# Altium project ARC_1.0.5.PrjPcb (part 1 of 3)
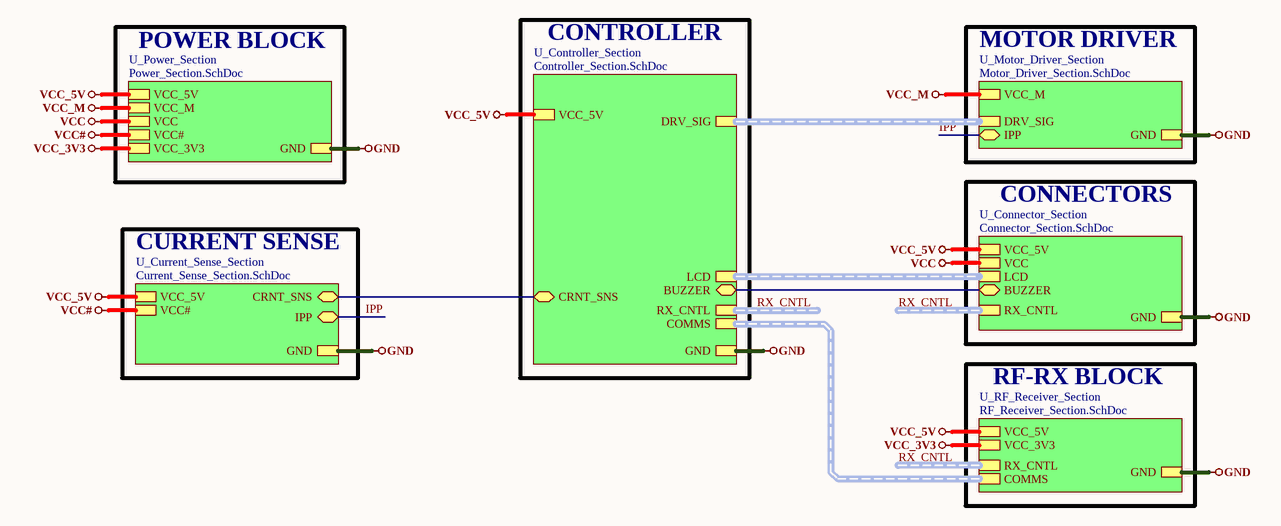
[diagram p0: Top_Sheet.SchDoc]
7 sheets, 201 parts. Net scope: hierarchical (ports join the sheet entries above them; power ports are global).
Board file: PCB_ARC_1.0.5.PcbDoc
Sheets:
  Top_Sheet.SchDoc
    U_Motor_Driver_Section = Motor_Driver_Section.SchDoc
    U_Connector_Section = Connector_Section.SchDoc
    U_Power_Section = Power_Section.SchDoc
    U_Controller_Section = Controller_Section.SchDoc
    U_Current_Sense_Section = Current_Sense_Section.SchDoc
    U_RF_Receiver_Section = RF_Receiver_Section.SchDoc

## Sheet Top_Sheet.SchDoc
size A4; DocumentNumber: 1; SheetNumber: 1; SheetTotal: 7

### Sub-sheets
U_Connector_Section = Connector_Section.SchDoc: RX_CNTL (harness RX_CNTRL), BUZZER (bidir), LCD (harness LCD), GND, VCC_5V, VCC
U_Controller_Section = Controller_Section.SchDoc: BUZZER (bidir), GND, VCC_5V, CRNT_SNS (bidir), RX_CNTL (harness RX_CNTRL), DRV_SIG (harness DRV_SIG), LCD (harness LCD), COMMS (harness COMMS)
U_Current_Sense_Section = Current_Sense_Section.SchDoc: CRNT_SNS (bidir), IPP (bidir), GND, VCC_5V, VCC#
U_Motor_Driver_Section = Motor_Driver_Section.SchDoc: DRV_SIG (harness DRV_SIG), IPP (bidir), GND, VCC_M
U_Power_Section = Power_Section.SchDoc: GND, VCC_5V, VCC_M, VCC#, VCC, VCC_3V3
U_RF_Receiver_Section = RF_Receiver_Section.SchDoc: GND, VCC_5V, VCC_3V3, COMMS (harness COMMS), RX_CNTL (harness RX_CNTRL)

### Nets
GND: sheet U_Motor_Driver_Section/GND, sheet U_Connector_Section/GND, sheet U_Power_Section/GND, sheet U_Controller_Section/GND, sheet U_Current_Sense_Section/GND, sheet U_RF_Receiver_Section/GND
VCC: sheet U_Connector_Section/VCC, sheet U_Power_Section/VCC
VCC#: sheet U_Power_Section/VCC#, sheet U_Current_Sense_Section/VCC#
VCC_3V3: sheet U_Power_Section/VCC_3V3, sheet U_RF_Receiver_Section/VCC_3V3
VCC_5V: sheet U_Connector_Section/VCC_5V, sheet U_Power_Section/VCC_5V, sheet U_Controller_Section/VCC_5V, sheet U_Current_Sense_Section/VCC_5V, sheet U_RF_Receiver_Section/VCC_5V
VCC_M: sheet U_Motor_Driver_Section/VCC_M, sheet U_Power_Section/VCC_M
BUZZER: sheet U_Connector_Section/BUZZER, sheet U_Controller_Section/BUZZER
CRNT_SNS: sheet U_Controller_Section/CRNT_SNS, sheet U_Current_Sense_Section/CRNT_SNS
IPP: sheet U_Motor_Driver_Section/IPP, sheet U_Current_Sense_Section/IPP

### Buses and harness runs
harness RX_CNTL = sheet U_Connector_Section/RX_CNTL
harness RX_CNTL = sheet U_Controller_Section/RX_CNTL
harness RX_CNTL = sheet U_RF_Receiver_Section/RX_CNTL
harness sheet U_Connector_Section/LCD = sheet U_Controller_Section/LCD
harness sheet U_Controller_Section/COMMS = sheet U_RF_Receiver_Section/COMMS
harness sheet U_Controller_Section/DRV_SIG = sheet U_Motor_Driver_Section/DRV_SIG

### Notes on the sheet
- POWER BLOCK
- CONTROLLER
- MOTOR DRIVER
- CURRENT SENSE
- CONNECTORS
- RF-RX BLOCK
- 1
- Huzaifa Ali

## Sheet Motor_Driver_Section.SchDoc
size A4; DocumentNumber: 5; SheetNumber: 5; SheetTotal: 7
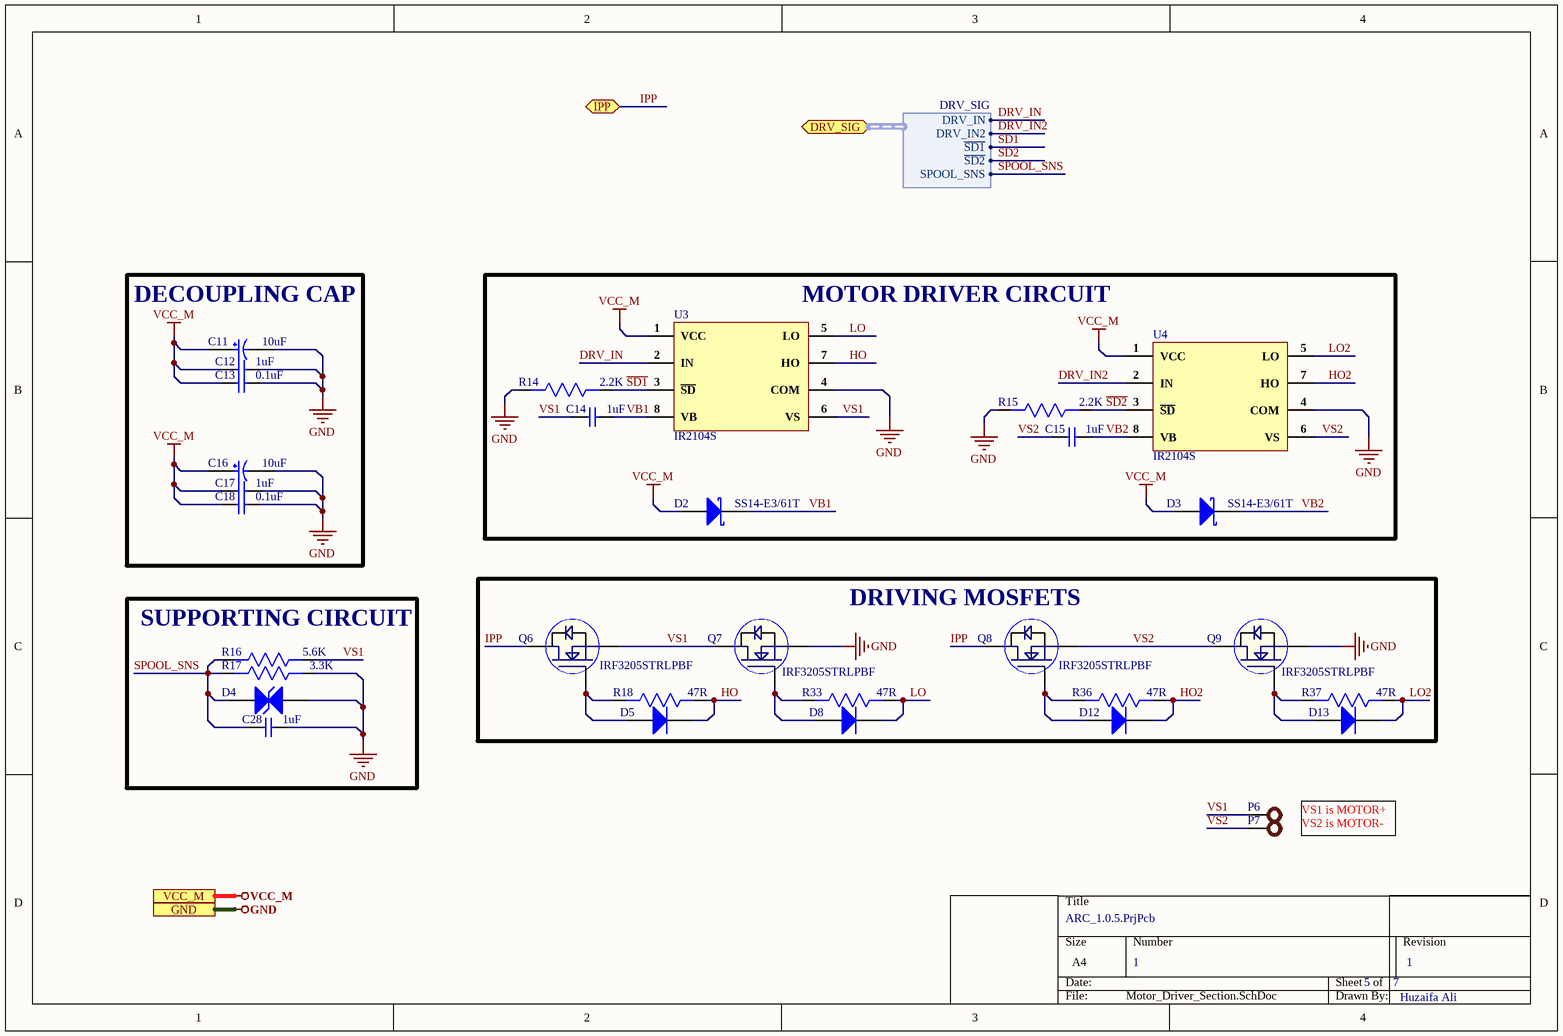
[diagram p1: Motor_Driver_Section.SchDoc]

### Parts
C11  10uF  [RVT1E100M0405.]
C12  1uF  [Cap0603]
C13  0.1uF  [Cap0603]
C14  1uF  [Cap0603]
C15  1uF  [Cap0603]
C16  10uF  [RVT1E100M0405.]
C17  1uF  [Cap0603]
C18  0.1uF  [Cap0603]
C28  1uF  [Cap0603]
D2  SS14-E3/61T  [SMA]
D3  SS14-E3/61T  [SMA]
D4  SMAJ5.0CA  [SMA]  (value not drawn)
D5  1N4148WS  [SOD-323]  (value not drawn)
D8  1N4148WS  [SOD-323]  (value not drawn)
D12  1N4148WS  [SOD-323]  (value not drawn)
D13  1N4148WS  [SOD-323]  (value not drawn)
P6  Test Point  [TEST POINT]  (value not drawn)
P7  Test Point  [TEST POINT]  (value not drawn)
Q6  IRF3205STRLPBF  [D2PAK]
Q7  IRF3205STRLPBF  [D2PAK]
Q8  IRF3205STRLPBF  [D2PAK]
Q9  IRF3205STRLPBF  [D2PAK]
R14  2.2K  [Res0603]
R15  2.2K  [Res0603]
R16  5.6K  [Res0603]
R17  3.3K  [Res0603]
R18  47R  [Res0603]
R33  47R  [Res0603]
R36  47R  [Res0603]
R37  47R  [Res0603]
U3  IR2104S  [SOIC-8]
U4  IR2104S  [SOIC-8]

### Blocks framed on the sheet
DECOUPLING CAP: C11-C13 C16-C18
MOTOR DRIVER CIRCUIT: C14 C15 D2 D3 R14 R15 U3 U4
SUPPORTING CIRCUIT: C28 D4 R16 R17
DRIVING MOSFETS: D5 D8 D12 D13 Q6-Q9 R18 R33 R36 R37

### Ports
DRV_SIG (bidir, harness DRV_SIG), GND, IPP (bidir), VCC_M

### Harnesses
DRV_SIG: DRV_IN, DRV_IN2, ~{SD1}, ~{SD2}, SPOOL_SNS

### Nets
GND: C11.2 C12.2 C13.2 C16.2 C17.2 C18.2 C28.2 D4.2(A) Q7.3(S) Q9.3(S) R14.2 R15.2 R17.1 U3.4(COM) U4.4(COM) ; port GND
VCC_M: C11.1 C12.1 C13.1 C16.1 C17.1 C18.1 D2.2(A) D3.2(A) U3.1(VCC) U4.1(VCC) ; port VCC_M
~{SD1}: R14.1 U3.3(~{SD}) ; port DRV_SIG.~{SD1}
~{SD2}: R15.1 U4.3(~{SD}) ; port DRV_SIG.~{SD2}
DRV_IN: U3.2(IN) ; port DRV_SIG.DRV_IN
DRV_IN2: U4.2(IN) ; port DRV_SIG.DRV_IN2
HO: D5.1(K) R18.1 U3.7(HO)
HO2: D12.1(K) R36.1 U4.7(HO)
IPP: Q6.2(D) Q8.2(D) ; port IPP
LO: D8.1(K) R33.1 U3.5(LO)
LO2: D13.1(K) R37.1 U4.5(LO)
SPOOL_SNS: C28.1 D4.1(A) R16.2 R17.2 ; port DRV_SIG.SPOOL_SNS
VB1: C14.2 D2.1(K) U3.8(VB)
VB2: C15.2 D3.1(K) U4.8(VB)
VS1: C14.1 P6.1 Q6.3(S) Q7.2(D) R16.1 U3.6(VS)
VS2: C15.1 P7.1 Q8.3(S) Q9.2(D) U4.6(VS)
NetD5_2: D5.2(A) Q6.1(G) R18.2
NetD8_2: D8.2(A) Q7.1(G) R33.2
NetD12_2: D12.2(A) Q8.1(G) R36.2
NetD13_2: D13.2(A) Q9.1(G) R37.2

### Notes on the sheet
- VS1 is MOTOR+
  VS2 is MOTOR-
- 1
- Huzaifa Ali

### Library data of the parts
C11 C16 = RVT1E100M0405: CAP ALUM 10uF 25V SMD; Manufacturer: ROQANG; φD: 4mm; L: 5.4mm; Tolerance: ±20%; Operating Temperature: -45℃~+105℃; Rated Voltage: 25V; Capacitance: 10uF
C12 C14 C15 C17 C28 = CL10A105KA8NNNC: CAP CER 1UF 25V X5R 0603; Manufacturer: Sams; Tolerance: 10%; Supplier 1: Digi-Key; Manufacturer Part Number: CL10A105KA8NNNC; Stock 1: 2768758; Pricing 1: 1=0.1, 10=0.036, 50=0.0198, 100=0.0161, 500=0.01152, 1000=0.00904 (USD); Mount: Surface Mount; Case/Package: 0603; Min Operating Temperature: -55°C; Max Operating Temperature: 85°C; Capacitance: 1uF; Dielectric: X5R; Voltage Rating (DC): 25V; Voltage: 25V; Length: 1.6mm; Height: 0.8mm; Depth: 0.8mm; Lead Free: Lead Free; Supplier Part Number 1: 1276-1102-1-ND
C13 C18 = CC0603KRX7R0BB104: CAP CER 0.1UF 100V X7R 0603; Manufacturer: Yageo; Capacitance: 100nF; Tolerance: 10%; Supplier 1: Digi-Key; Manufacturer Part Number: CC0603KRX7R0BB104; RoHS: Yes; Category: Ceramic Capacitors; Stock 1: 60476; Pricing 1: 1=0.19000, 10=0.13500, 50=0.07680, 100=0.06370, 500=0.04466, 1000=0.03696 (USD); Mount: Surface Mount; Case/Package: 0603; Case Code (Metric): 1608; Case Code (Imperial): 0603; Weight: 7.1E-05oz; Min Operating Temperature: -55°C; Max Operating Temperature: 125°C; Package Quantity: 4000; Voltage Rating: 100V; Packaging: Tape and Reel; Dielectric: X7R; Termination: SMD/SMT; Resistor Type: Ceramic; Voltage Rating (DC): 100V; Series: CC; Length: 0.063inch; Width: 0.031inch; Thickness: 0.035inch; Depth: 0.8mm; Lead Free: Lead Free; RoHS Compliant: Yes; ComponentLink1URL: https://datasheet.ciiva.com/6277/mlccorderingcode-6277030.pdf?src-supplier=Digi-Key; ComponentLink1Description: https://datasheet.ciiva.com/6277/mlccorderingcode-6277030.pdf?src-supplier=Digi-Key; ComponentLink2URL: https://datasheet.ciiva.com/6277/mlccorderingcode-6277081.pdf?src-supplier=Digi-Key; ComponentLink2Description: https://datasheet.ciiva.com/6277/mlccorderingcode-6277081.pdf?src-supplier=Digi-Key; ComponentLink3URL: https://datasheet.ciiva.com/6277/mlccorderingcode-6277082.pdf?src-supplier=Digi-Key; ComponentLink3Description: https://datasheet.ciiva.com/6277/mlccorderingcode-6277082.pdf?src-supplier=Digi-Key; Supplier Part Number 1: 311-1523-1-ND
D2 D3 = SS14-E3/61T: 40V 500mV@1A 1A SMA(DO-214AC) Schottky Barrier Diodes (SBD) ROHS; Manufacturer: Vishay Semiconductors; Forward Voltage: 500mV; Max Reverse Current: 200uA; Element Configuration: Single; Peak Non-Repetitive Surge Current: 40A; Polarity: Standard; Supplier 1: Arrow Electronics; Manufacturer Part Number: SS14-E3/61T; RoHS: Yes; Category: Rectifier Diodes; Stock 1: 100; Pricing 1: 1=0.14040, 10=0.13900, 25=0.11710, 100=0.10990 (USD); Mount: Surface Mount; Case/Package: SMA; Number of Pins: 2; Contact Plating: Tin,Matte; Min Operating Temperature: -65°C; Max Operating Temperature: 125°C; Packaging: Tape and Reel; Forward Current: 1A; Max Repetitive Reverse Voltage (Vrrm): 40V; Max Forward Surge Current (Ifsm): 40A; Voltage Rating (DC): 40V; Current Rating: 1A; Output Current: 1A; Max Surge Current: 40A; Package Quantity: 1; Max Reverse Leakage Current: 200uA; Average Rectified Current: 1A; Current: 1A; Voltage: 40V; Max Reverse Voltage (DC): 40V; Series: -; Termination: SMD/SMT; Length: 4.6mm; Width: 2.9mm; Radiation Hardening: No; Lead Free: Lead Free; REACH SVHC: Unknown; Supplier Part Number 1: SS14-E3/61T
D4 = SMAJ5.0CA: 43.5A 9.2V 6.4V 5V Bi-Directional SMA(DO-214AC) TVS ROHS; Manufacturer: Bourns; Breakdown Voltage: 7V; Polarity: Bidirectional; Peak Pulse Power: 400W; Test Current: 10mA; Element Configuration: Single; Max Surge Current: 40A; Max Reverse Leakage Current: 1.6mA; Number of Channels: 1; Power Line Protection: No; Diode Type: ZENER; ESD Protection: Yes; Supplier 1: RSComponents; Manufacturer Part Number: SMAJ5.0CA; RoHS: Yes; Category: TVS Diodes; Stock 1: 4825; Pricing 1: 5000=0.16400, 10000=0.16000, 15000=0.15600 (GBP); Mount: Surface Mount; Case/Package: DO-214AC; Number of Pins: 2; Contact Plating: Tin; Min Operating Temperature: -55°C; Max Operating Temperature: 150°C; Reverse Standoff Voltage: 5V; Clamping Voltage: 9.2V; Direction: Bidirectional; Packaging: Tape and Reel; Min Breakdown Voltage: 6.4V; Peak Pulse Current: 43.5A; Package Quantity: 1; Operating Supply Voltage: 5V; Max Power Dissipation: 400W; Termination: SMD/SMT; Reverse Breakdown Voltage: 6.4V; Max Breakdown Voltage: 7V; Number of Elements: 1; Leakage Current: 1.6mA; Number of Bidirectional Channels: 1; Resistor Type: Zener; Series: SMAJ; Radiation Hardening: No; RoHS Compliant: Yes; REACH SVHC: No SVHC; ComponentLink1URL: https://datasheet.ciiva.com/11336/smaj-11336795.pdf?src-supplier=Avnet; ComponentLink1Description: https://datasheet.ciiva.com/11336/smaj-11336795.pdf?src-supplier=Avnet; ComponentLink2URL: https://datasheet.ciiva.com/3022/smaj-3022286.pdf?src-supplier=Avnet; ComponentLink2Description: https://datasheet.ciiva.com/3022/smaj-3022286.pdf?src-supplier=Avnet; ComponentLink3URL: https://datasheet.ciiva.com/334/smaj-334523.pdf?src-supplier=Digi-Key; ComponentLink3Description: https://datasheet.ciiva.com/334/smaj-334523.pdf?src-supplier=Digi-Key; ComponentLink4URL: https://datasheet.ciiva.com/334/smaj-334524.pdf?src-supplier=Digi-Key; ComponentLink4Description: https://datasheet.ciiva.com/334/smaj-334524.pdf?src-supplier=Digi-Key; ComponentLink5URL: https://datasheet.ciiva.com/334/smaj-334522.pdf?src-supplier=Digi-Key; ComponentLink5Description: https://datasheet.ciiva.com/334/smaj-334522.pdf?src-supplier=Digi-Key; ComponentLink6URL: https://datasheet.ciiva.com/30090/smaj-30090141.pdf?src-supplier=Onlinecomponents.com; ComponentLink6Description: https://datasheet.ciiva.com/30090/smaj-30090141.pdf?src-supplier=Onlinecomponents.com; ComponentLink7URL: https://datasheet.ciiva.com/17413/smaj-17413550.pdf?; ComponentLink7Description: https://datasheet.ciiva.com/17413/smaj-17413550.pdf?; Supplier Part Number 1: 1742481
D5 D8 D12 D13 = 1N4148WS: 100V -55℃~+150℃@(Tj) 400mW Single 1.25V@150mA 4ns 1μA@75V 200mA SOD-323 Switching Diode ROHS; Manufacturer: YFW; ComponentLink1Description: LCSC; ComponentLink1URL: https://lcsc.com/product-detail/Switching-Diode_YFW-1N4148WS_C1884546.html; Manufacturer Part Number: 1N4148WS
P6 P7 = TEST POINT: Test Point ON
Q6-Q9 = IRF3205STRLPBF: MOSFET N-CH 55V 110A D2PAK; Manufacturer: Infineon; Input Capacitance: 3.247nF; Power Dissipation: 200W; Gate to Source Voltage (Vgs): 20V; Rds On Max: 8mR; Turn-Off Delay Time: 50ns; Turn-On Delay Time: 14ns; Threshold Voltage: 4V; Supplier 1: Newark; Manufacturer Part Number: IRF3205STRLPBF; RoHS: Yes; Category: MOSFETs; Pricing 1: 1=2.87000, 10=2.59000, 25=2.42000, 50=2.25000, 100=2.09000, 250=1.90000, 500=1.71000 (USD); Mount: Surface Mount; Case/Package: D2PAK; Number of Pins: 3; Min Operating Temperature: -55°C; Max Operating Temperature: 175°C; Packaging: Cut Tape; Continuous Drain Current (ID): 110A; Drain to Source Breakdown Voltage: 55V; Drain to Source Voltage (Vdss): 55V; Max Power Dissipation: 200W; Drain to Source Resistance: 8mR; Max Dual Supply Voltage: 55V; Length: 0.42inch; Width: 0.38inch; Height: 0.19inch; Lead Free: Contains Lead; RoHS Compliant: Yes; REACH SVHC: No SVHC; Halogen Free: Halogen Free; Supplier Part Number 1: 42Y0386
R14 R15 = RC0603FR-072K2L: RES SMD 2.2K OHM 1% 1/10W 0603; Manufacturer: Yageo Phycomp; Temperature Coefficient: 100ppm/°C; Resistance: 2.2kR; Power Rating: 100mW; Voltage Rating (DC): 50V; Supplier 1: Digi-Key; Manufacturer Part Number: RC0603FR-072K2L; Stock 1: 10587920; Pricing 1: 1=0.1, 10=0.023, 100=0.0094, 1000=0.00421, 2500=0.00366 (USD); Mount: Surface Mount; Case/Package: 0603; Number of Pins: 2; Min Operating Temperature: -55°C; Max Operating Temperature: 155°C; Tolerance: 1%; Packaging: Cut Tape; Length: 1.6mm; Height: 0.45mm; Width: 800um; Depth: 0.8mm; REACH SVHC: No SVHC; Lead Free: Lead Free; Supplier Part Number 1: 311-2.20KHRCT-ND
R16 = PTFR0603B5K60P9: 100mW Thin Film Resistor 100V 5.6kΩ 0603 Chip Resistor; Manufacturer: Resistor; Manufacturer Part Number: PTFR0603B5K60P9; Value: 5.6K; Footprint: 0603; ComponentLink1Description: LCSC; ComponentLink1URL: https://lcsc.com/product-detail/Chip-span-style-background-color-ff0-Resistor-span-Surface-Mount_span-style-background-color-ff0-Resistor-span-Today-PTFR0603B5K60P9_C351638.html
R17 = RT0603BRD073K3L: RES SMD 3.3K OHM 0.1% 1/10W 0603; Manufacturer: Yageo; Resistance: 3.3kR; Power Rating: 100mW; Voltage Rating: 75V; Temperature Coefficient: 25ppm/°C; Voltage Rating (DC): 50V; Supplier 1: Newark; Manufacturer Part Number: RT0603BRD073K3L; RoHS: Yes; Category: Chip SMD Resistors; Stock 1: 7026; Pricing 1: 1=0.26300, 10=0.16400, 25=0.12800, 50=0.09300, 100=0.05700 (USD); Case/Package: 0603; Case Code (Metric): 1608; Case Code (Imperial): 0603; Contact Plating: Tin,Lead; Min Operating Temperature: -55°C; Max Operating Temperature: 125°C; Package Quantity: 5000; Packaging: Tape and Reel; Tolerance: 0.1%; Resistor Type: Thin Film; Number of Terminations: 2; Termination: SMD/SMT; Max Power Dissipation: 100mW; Features: Moisture Resistant; Series: RT; Construction: Rectangular; Length: 0.063inch; Width: 0.031inch; Height: 0.022inch; Depth: 0.8mm; Military Standard: Not; Lead Free: Lead Free; RoHS Compliant: Yes; ComponentLink1URL: https://datasheet.ciiva.com/11814/0900766b8027bd26-11814026.pdf?src-supplier=RSComponents; ComponentLink1Description: https://datasheet.ciiva.com/11814/0900766b8027bd26-11814026.pdf?src-supplier=RSComponents; ComponentLink2URL: https://datasheet.ciiva.com/2585/pyu-rt-1-to-0-05-rohs-l-4-2585926.pdf?src-supplier=Digi-Key; ComponentLink2Description: https://datasheet.ciiva.com/2585/pyu-rt-1-to-0-05-rohs-l-4-2585926.pdf?src-supplier=Digi-Key; ComponentLink3URL: https://datasheet.ciiva.com/12694/pyu-rt-1-to-0-05-rohs-l-4-12694839.pdf?src-supplier=Mouser; ComponentLink3Description: https://datasheet.ciiva.com/12694/pyu-rt-1-to-0-05-rohs-l-4-12694839.pdf?src-supplier=Mouser; Supplier Part Number 1: 82AH8918
R18 R33 R36 R37 = RC0603FR-0747RL: RES SMD 47OHM 0.1W 0603; Manufacturer: Yageo; Tolerance: 1%; Power Rating: 100mW; Voltage Rating (DC): 50V; Temperature Coefficient: 100ppm/°C; Voltage Rating: 75V; Supplier 1: Digi-Key; Manufacturer Part Number: RC0603FR-0747RL; RoHS: Yes; Category: Chip SMD Resistors; Stock 1: 596562; Pricing 1: 1=0.10000, 10=0.02400, 100=0.00970, 1000=0.00436, 2500=0.00378 (USD); Case/Package: 0603; Number of Pins: 2; Case Code (Imperial): 0603; Case Code (Metric): 1608; Weight: 7.1E-05oz; Size Code: 0603; Min Operating Temperature: -55°C; Max Operating Temperature: 155°C; Resistance: 47R; Packaging: Tape and Reel; Package Quantity: 1; Termination: SMD/SMT; Resistor Type: Thick Film; Number of Terminations: 2; Max Power Dissipation: 100mW; Features: Moisture Resistant; Series: RC; Construction: Rectangular; Resistance Tolerance: 1%; Length: 1.6mm; Width: 0.8mm; Height: 0.022inch; Depth: 0.8mm; REACH SVHC: Unknown; Lead Free: Lead Free; Military Standard: Not; RoHS Compliant: Yes; ComponentLink1URL: https://datasheet.ciiva.com/2453/pyu-r-int-thick-7-2453922.pdf?src-supplier=Digi-Key; ComponentLink1Description: https://datasheet.ciiva.com/2453/pyu-r-int-thick-7-2453922.pdf?src-supplier=Digi-Key; ComponentLink2URL: https://datasheet.ciiva.com/2453/pyu-r-int-thick-7-2453923.pdf?src-supplier=Digi-Key; ComponentLink2Description: https://datasheet.ciiva.com/2453/pyu-r-int-thick-7-2453923.pdf?src-supplier=Digi-Key; ComponentLink3URL: https://datasheet.ciiva.com/2453/pyu-r-int-thick-7-2453924.pdf?src-supplier=Digi-Key; ComponentLink3Description: https://datasheet.ciiva.com/2453/pyu-r-int-thick-7-2453924.pdf?src-supplier=Digi-Key; ComponentLink4URL: https://datasheet.ciiva.com/7746/443971-7746363.pdf?src-supplier=Element14; ComponentLink4Description: https://datasheet.ciiva.com/7746/443971-7746363.pdf?src-supplier=Element14; ComponentLink5URL: https://datasheet.ciiva.com/7746/443971-7746364.pdf?src-supplier=Element14; ComponentLink5Description: https://datasheet.ciiva.com/7746/443971-7746364.pdf?src-supplier=Element14; ComponentLink6URL: https://datasheet.ciiva.com/46440/1868787-46440908.pdf?src-supplier=Element14; ComponentLink6Description: https://datasheet.ciiva.com/46440/1868787-46440908.pdf?src-supplier=Element14; Supplier Part Number 1: 311-47.0HRCT-ND
U3 U4 = IR2104S: IC DRIVER HIGH/LOW SIDE 8SOIC; Manufacturer: Infineon; Manufacturer Part Number: IR2104STRPBF; Number of Outputs: 2; Max Output Current: 360mA; Min Supply Voltage: 10V; Max Supply Voltage: 20V; Fall Time: 90ns; Propagation Delay: 680ns; Channel Type: Synchronous; Supplier 1: Newark; RoHS: Yes; Category: Gate Drivers; Stock 1: 1645; Pricing 1: 1=3.54000, 10=3.19000, 25=3.01000 (USD); Mount: Surface Mount; Case/Package: SOIC; Number of Pins: 8; Min Operating Temperature: -40°C; Max Operating Temperature: 150°C; Package Quantity: 1; Packaging: Cut Tape; Number of Drivers: 2; Output Current: 360mA; Number of Channels: 2; Length: 0.196inch; Width: 0.157inch; Height: 0.059inch; RoHS Compliant: Yes; REACH SVHC: No SVHC; Lead Free: Lead Free; Halogen Free: Not Halogen Free; Supplier Part Number 1: 40M8006

## Sheet Connector_Section.SchDoc
size A4; DocumentNumber: 7; SheetNumber: 7; SheetTotal: 7
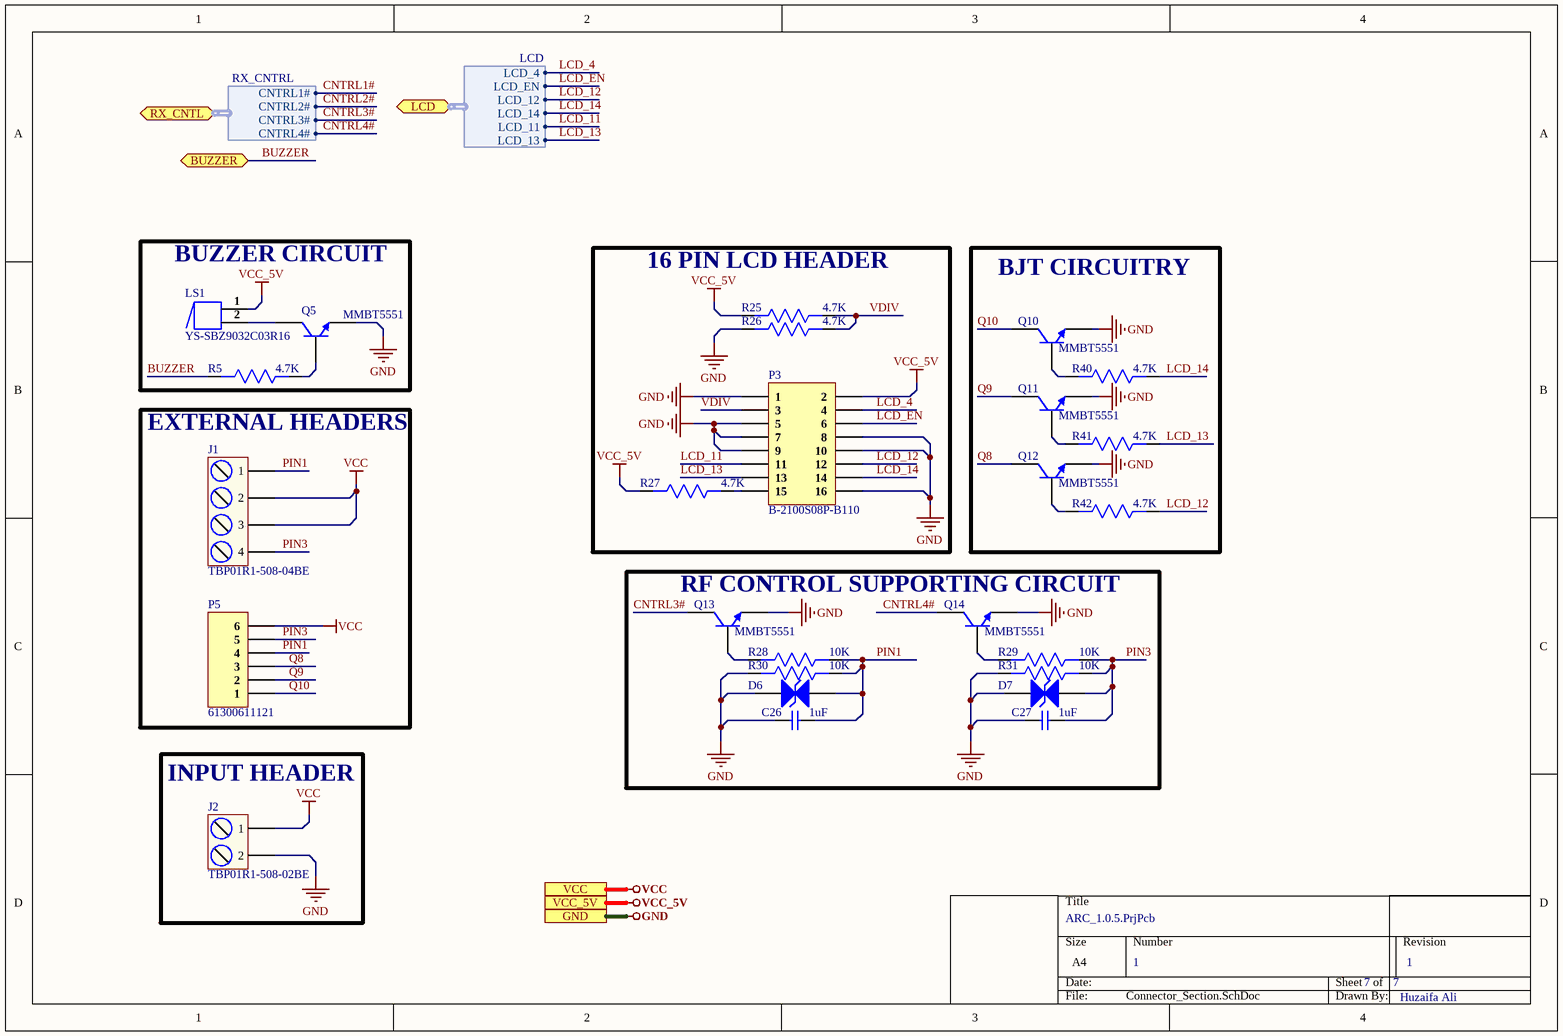
[diagram p2: Connector_Section.SchDoc]

### Parts
C26  1uF  [Cap0603]
C27  1uF  [Cap0603]
D6  SMAJ5.0CA  [SMA]  (value not drawn)
D7  SMAJ5.0CA  [SMA]  (value not drawn)
J1  TBP01R1-508-04BE  [TBP01R1-508-04BE]
J2  TBP01R1-508-02BE  [TBP01R1-508-02BE]
LS1  YS-SBZ9032C03R16  [YS-SBZ9032C03R16]
P3  B-2100S08P-B110  [B-2100S08P-B110]
P5  61300611121  [HDR1X6]
Q5  MMBT5551  [SOT23-3]
Q10  MMBT5551  [SOT23-3]
Q11  MMBT5551  [SOT23-3]
Q12  MMBT5551  [SOT23-3]
Q13  MMBT5551  [SOT23-3]
Q14  MMBT5551  [SOT23-3]
R5  4.7K  [Res-0603]
R25  4.7K  [Res0603]
R26  4.7K  [Res0603]
R27  4.7K  [Res0603]
R28  10K  [Res0603]
R29  10K  [Res0603]
R30  10K  [Res0603]
R31  10K  [Res0603]
R40  4.7K  [Res0603]
R41  4.7K  [Res0603]
R42  4.7K  [Res0603]

### Blocks framed on the sheet
BUZZER CIRCUIT: LS1 Q5 R5
16 PIN LCD HEADER: P3 R25-R27
BJT CIRCUITRY: Q10-Q12 R40-R42
EXTERNAL HEADERS: J1 P5
RF CONTROL SUPPORTING CIRCUIT: C26 C27 D6 D7 Q13 Q14 R28-R31
INPUT HEADER: J2

### Ports
BUZZER (bidir), GND, LCD (bidir, harness LCD), RX_CNTL (bidir, harness RX_CNTRL), VCC, VCC_5V

### Harnesses
RX_CNTRL: CNTRL1#, CNTRL2#, CNTRL3#, CNTRL4#
LCD: LCD_4, LCD_EN, LCD_12, LCD_14, LCD_11, LCD_13

### Nets
GND: C26.1 C27.1 D6.1(A) D7.1(A) J2.2 P3.1 P3.5 P3.7 P3.8 P3.9 P3.10 P3.16 Q5.2(E) Q10.2(E) Q11.2(E) Q12.2(E) Q13.2(E) Q14.2(E) R26.2 R30.2 R31.2 ; port GND
VCC: J1.2 J1.3 J2.1 P5.6 ; port VCC
VCC_5V: LS1.1 P3.2 R25.2 R27.2 ; port VCC_5V
BUZZER: R5.2 ; port BUZZER
CNTRL1#: port RX_CNTL.CNTRL1#
CNTRL3#: Q13.3(C) ; port RX_CNTL.CNTRL3#
CNTRL4#: Q14.3(C) ; port RX_CNTL.CNTRL4#
LCD_4: P3.4 ; port LCD.LCD_4
LCD_11: P3.11 ; port LCD.LCD_11
LCD_12: P3.12 R42.1 ; port LCD.LCD_12
LCD_13: P3.13 R41.1 ; port LCD.LCD_13
LCD_14: P3.14 R40.1 ; port LCD.LCD_14
LCD_EN: P3.6 ; port LCD.LCD_EN
PIN1: C26.2 D6.2(A) J1.1 P5.4 R28.1 R30.1
PIN3: C27.2 D7.2(A) J1.4 P5.5 R29.1 R31.1
Q8: P5.3 Q12.3(C)
Q9: P5.2 Q11.3(C)
Q10: P5.1 Q10.3(C)
VDIV: P3.3 R25.1 R26.1
NetLS1_2: LS1.2 Q5.3(C)
NetP3_15: P3.15 R27.1
NetQ5_1: Q5.1(B) R5.1
NetQ10_1: Q10.1(B) R40.2
NetQ11_1: Q11.1(B) R41.2
NetQ12_1: Q12.1(B) R42.2
NetQ13_1: Q13.1(B) R28.2
NetQ14_1: Q14.1(B) R29.2

### Notes on the sheet
- 1
- Huzaifa Ali

### Library data of the parts
C26 C27 = CL10A105KA8NNNC: as C12 on sheet Motor_Driver_Section; Supplier 1: Digi-Key; Manufacturer Part Number: CL10A105KA8NNNC; Stock 1: 2768758; Pricing 1: 1=0.1, 10=0.036, 50=0.0198, 100=0.0161, 500=0.01152, 1000=0.00904 (USD); Mount: Surface Mount; Case/Package: 0603; Min Operating Temperature: -55°C; Max Operating Temperature: 85°C; Capacitance: 1uF; Dielectric: X5R; Voltage Rating (DC): 25V; Voltage: 25V; Length: 1.6mm; Height: 0.8mm; Depth: 0.8mm; Lead Free: Lead Free; Supplier Part Number 1: 1276-1102-1-ND
D6 D7 = SMAJ5.0CA: as D4 on sheet Motor_Driver_Section; Supplier 1: RSComponents; Manufacturer Part Number: SMAJ5.0CA; RoHS: Yes; Category: TVS Diodes; Stock 1: 4825; Pricing 1: 5000=0.16400, 10000=0.16000, 15000=0.15600 (GBP); Mount: Surface Mount; Case/Package: DO-214AC; Number of Pins: 2; Contact Plating: Tin; Min Operating Temperature: -55°C; Max Operating Temperature: 150°C; Reverse Standoff Voltage: 5V; Clamping Voltage: 9.2V; Direction: Bidirectional; Packaging: Tape and Reel; Min Breakdown Voltage: 6.4V; Peak Pulse Current: 43.5A; Package Quantity: 1; Operating Supply Voltage: 5V; Max Power Dissipation: 400W; Termination: SMD/SMT; Reverse Breakdown Voltage: 6.4V; Max Breakdown Voltage: 7V; Number of Elements: 1; Leakage Current: 1.6mA; Number of Bidirectional Channels: 1; Resistor Type: Zener; Series: SMAJ; Radiation Hardening: No; RoHS Compliant: Yes; REACH SVHC: No SVHC; ComponentLink1URL: https://datasheet.ciiva.com/11336/smaj-11336795.pdf?src-supplier=Avnet; ComponentLink1Description: https://datasheet.ciiva.com/11336/smaj-11336795.pdf?src-supplier=Avnet; ComponentLink2URL: https://datasheet.ciiva.com/3022/smaj-3022286.pdf?src-supplier=Avnet; ComponentLink2Description: https://datasheet.ciiva.com/3022/smaj-3022286.pdf?src-supplier=Avnet; ComponentLink3URL: https://datasheet.ciiva.com/334/smaj-334523.pdf?src-supplier=Digi-Key; ComponentLink3Description: https://datasheet.ciiva.com/334/smaj-334523.pdf?src-supplier=Digi-Key; ComponentLink4URL: https://datasheet.ciiva.com/334/smaj-334524.pdf?src-supplier=Digi-Key; ComponentLink4Description: https://datasheet.ciiva.com/334/smaj-334524.pdf?src-supplier=Digi-Key; ComponentLink5URL: https://datasheet.ciiva.com/334/smaj-334522.pdf?src-supplier=Digi-Key; ComponentLink5Description: https://datasheet.ciiva.com/334/smaj-334522.pdf?src-supplier=Digi-Key; ComponentLink6URL: https://datasheet.ciiva.com/30090/smaj-30090141.pdf?src-supplier=Onlinecomponents.com; ComponentLink6Description: https://datasheet.ciiva.com/30090/smaj-30090141.pdf?src-supplier=Onlinecomponents.com; ComponentLink7URL: https://datasheet.ciiva.com/17413/smaj-17413550.pdf?; ComponentLink7Description: https://datasheet.ciiva.com/17413/smaj-17413550.pdf?; Supplier Part Number 1: 1742481
J1 = TBP01R1-508-04BE: TERMINAL BLOCK, PLUGGABLE, 5.08,; Manufacturer: CUI Devices; Supplier 1: Arrow Electronics; Manufacturer Part Number: TBP01R1-508-04BE; RoHS: Yes; Category: Terminal Blocks; Stock 1: 697; Pricing 1: 1=0.77380, 10=0.29040, 25=0.28750, 50=0.25070, 200=0.24820, 400=0.24580, 600=0.22570 (USD); Supplier Part Number 1: TBP01R1-508-04BE
J2 = TBP01R1-508-02BE: TERMINAL BLOCK, PLUGGABLE, 5.08,; Manufacturer: CUI Devices; Supplier 1: Arrow Electronics; Manufacturer Part Number: TBP01R1-508-02BE; RoHS: Yes; Category: Terminal Blocks; Stock 1: 1821; Pricing 1: 1=0.57450, 10=0.23530, 25=0.18730, 50=0.17170, 100=0.16040, 400=0.14010, 800=0.12060, 1200=0.11290 (USD); Supplier Part Number 1: TBP01R1-508-02BE
LS1 = YS-SBZ9032C03R16: NO 2700Hz 85dB @ 3V, 10cm 3V Φ9mm SMD,9x3.2mm Buzzers RoHS; Manufacturer: Fengming; Operating Voltage: 2 ~ 4V; Package: SMD,9x3.2mm; Frequency - Self Resonant: 2700Hz; Rated Voltage: 3V
P3 = B-2100S08P-B110: Straight 2.54mm 6mm -40℃~+105℃ 2 3mm 8 2.54mm Black Brass 2x4P 2.54mm Plugin,P=2.54mm Pin Headers; Manufacturer: Ckmtw(Shenzhen Cankemeng); Mounting Type: Straight; Insulation Height: 2.54mm; Length of Mating Pin: 6mm; Operating Temperature Range: -40℃~+105℃; Number of Rows: 2; Length of End Connection Pin: 3mm
P5 = 61300611121: CONN HEADER 6 POS 2.54; Manufacturer: Wurth Electronics; Current Rating: 3A; Voltage Rating: 250V; Number of Positions: 6; Gender: Male; Connector Type: Male Pin; Pitch: 0.1inch; Supplier 1: Newark; Manufacturer Part Number: 61300611121; RoHS: Yes; Category: Headers and Wire Housings; Stock 1: 4996; Pricing 1: 1=0.34000, 10=0.28900, 25=0.24000, 50=0.20100, 100=0.18200 (USD); Mount: Through Hole; Contact Plating: Gold; Contact Material: Copper Alloy,Copper; Housing Material: PBT; Color: Black; Min Operating Temperature: -40°C; Max Operating Temperature: 125°C; Number of Rows: 1; Contact Gender: Male; Packaging: Bulk; Termination: Through Hole; Number of Contacts: 6; Series: WR-PHD; Contact Type: Male Pin; Contact Mating Length: 0.236inch; REACH SVHC: Unknown; Lead Free: Lead Free; RoHS Compliant: Yes; ComponentLink1URL: http://www.mouser.com/ds/2/445/6130xx11121-538006.pdf?src-supplier=Mouser; ComponentLink1Description: http://www.mouser.com/ds/2/445/6130xx11121-538006.pdf?src-supplier=Mouser; ComponentLink2URL: http://www.farnell.com/cad/1737268.pdf?src-supplier=Element14; ComponentLink2Description: http://www.farnell.com/cad/1737268.pdf?src-supplier=Element14; ComponentLink3URL: https://katalog.we-online.de/em/datasheet/6130xx11121.pdf?src-supplier=Digi-Key; ComponentLink3Description: https://katalog.we-online.de/em/datasheet/6130xx11121.pdf?src-supplier=Digi-Key; Supplier Part Number 1: 20X0957
Q5 Q10-Q14 = MMBT5551: TRANS NPN 160V 0.6A SOT23; Manufacturer: ON Semiconductor; Manufacturer Part Number: MMBT5551LT1G; Max Power Dissipation: 225mW; Max Collector Current: 600mA; Collector Base Voltage (VCBO): 180V; Emitter Base Voltage (VEBO): 6V; Element Configuration: Single; Number of Elements: 1; hFE Min: 80; Power Dissipation: 300mW; Collector Emitter Saturation Voltage: 150mV; Collector-emitter Voltage-Max: 200mV; Supplier 1: Newark; RoHS: Yes; Category: BJTs; Stock 1: 100073; Pricing 1: 1=0.20900, 5=0.20900, 10=0.15200, 100=0.08400, 500=0.06700 (USD); Case/Package: SOT-23-3; Number of Pins: 3; Weight: 0.01lb; Contact Plating: Tin,Matte; Min Operating Temperature: -55°C; Max Operating Temperature: 150°C; Collector Emitter Voltage (VCEO): 160V; Packaging: Tape and Reel; Collector Emitter Breakdown Voltage: 160V; Polarity: NPN; Package Quantity: 1; Max Breakdown Voltage: 160V; Voltage Rating (DC): 160V; Current Rating: 600mA; Series: -; Length: 2.9mm; Width: 1.3mm; Height: 0.94mm; Radiation Hardening: No; Lead Free: Lead Free; RoHS Compliant: Yes; REACH SVHC: No SVHC; ComponentLink1URL: https://datasheet.ciiva.com/34303/2011387-34303825.pdf?src-supplier=Jameco; ComponentLink1Description: https://datasheet.ciiva.com/34303/2011387-34303825.pdf?src-supplier=Jameco; ComponentLink2URL: https://datasheet.ciiva.com/15139/getdatasheetpartid-92641-15139178.pdf?src-supplier=Verical; ComponentLink2Description: https://datasheet.ciiva.com/15139/getdatasheetpartid-92641-15139178.pdf?src-supplier=Verical; ComponentLink3URL: https://datasheet.ciiva.com/976/mmbt5550lt1-d-976512.pdf?src-supplier=Digi-Key; ComponentLink3Description: https://datasheet.ciiva.com/976/mmbt5550lt1-d-976512.pdf?src-supplier=Digi-Key; ComponentLink4URL: https://datasheet.ciiva.com/16984/0900766b8078eb1b-16984971.pdf?src-supplier=Allied+Electronics; ComponentLink4Description: https://datasheet.ciiva.com/16984/0900766b8078eb1b-16984971.pdf?src-supplier=Allied+Electronics; ComponentLink5URL: https://datasheet.ciiva.com/7972/mmbt5550lt1-d-7972073.pdf?src-supplier=Element14; ComponentLink5Description: https://datasheet.ciiva.com/7972/mmbt5550lt1-d-7972073.pdf?src-supplier=Element14; ComponentLink6URL: https://datasheet.ciiva.com/7972/mmbt5550lt1-d-7972075.pdf?src-supplier=Element14; ComponentLink6Description: https://datasheet.ciiva.com/7972/mmbt5550lt1-d-7972075.pdf?src-supplier=Element14; ComponentLink7URL: https://datasheet.ciiva.com/4722/mmbt5550lt1-d-111393-4722711.pdf?src-supplier=Mouser; ComponentLink7Description: https://datasheet.ciiva.com/4722/mmbt5550lt1-d-111393-4722711.pdf?src-supplier=Mouser; ComponentLink8URL: https://datasheet.ciiva.com/11197/mmbt5550lt1-d-11197404.pdf?src-supplier=Avnet; ComponentLink8Description: https://datasheet.ciiva.com/11197/mmbt5550lt1-d-11197404.pdf?src-supplier=Avnet; ComponentLink9URL: https://datasheet.ciiva.com/16342/mmbt5550lt1-d-16342687.pdf?src-supplier=Future+Electronics; ComponentLink9Description: https://datasheet.ciiva.com/16342/mmbt5550lt1-d-16342687.pdf?src-supplier=Future+Electronics; ComponentLink10URL: https://datasheet.ciiva.com/976/mmbt5550lt1-d-976513.pdf?src-supplier=Digi-Key; ComponentLink10Description: https://datasheet.ciiva.com/976/mmbt5550lt1-d-976513.pdf?src-supplier=Digi-Key; ComponentLink11URL: https://datasheet.ciiva.com/976/mmbt5550lt1-d-976511.pdf?src-supplier=Digi-Key; ComponentLink11Description: https://datasheet.ciiva.com/976/mmbt5550lt1-d-976511.pdf?src-supplier=Digi-Key; Supplier Part Number 1: 58M9157
R5 = RC0603JR-074K7L: RES SMD 4.7K OHM 5% 1/10W 0603; Manufacturer: Yageo; Resistance: 4.7kR; Temperature Coefficient: 100ppm/°C; Voltage Rating (DC): 50V; Power Rating: 100mW; Supplier 1: Digi-Key; Manufacturer Part Number: RC0603JR-074K7L; Stock 1: 19706643; Pricing 1: 1=0.1, 10=0.02, 100=0.0081, 1000=0.00362, 2500=0.00314 (USD); Case/Package: 0603; Number of Pins: 2; Case Code (Imperial): 0603; Case Code (Metric): 1608; Min Operating Temperature: -55°C; Max Operating Temperature: 155°C; Tolerance: 5%; Composition: Thick Film; Packaging: Tape and Reel; Voltage Rating: 50V; Termination: SMD/SMT; Military Standard: Not; Length: 1.6mm; Width: 0.8mm; Depth: 0.8mm; REACH SVHC: No SVHC; Lead Free: Lead Free; ComponentLink1URL: http://www.farnell.com/datasheets/443971.pdf?src-supplier=Element14; ComponentLink1Description: http://www.farnell.com/datasheets/443971.pdf?src-supplier=Element14; Supplier Part Number 1: 311-4.7KGRCT-ND; LCSC Part Number: C105428
R25-R27 R40-R42 = AT0603BRD074K7L: RES SMD 4.7K OHM 0.1% 1/10W 0603; Manufacturer: Yageo; Resistance: 4.7kR; Max Power Dissipation: 100mW; Temperature Coefficient: 25ppm/°C; Supplier 1: Digi-Key; Manufacturer Part Number: AT0603BRD074K7L; Stock 1: 7928; Pricing 1: 1=0.56, 10=0.431, 100=0.181, 1000=0.09986, 2500=0.09362 (USD); Case/Package: 0603; Case Code (Metric): 1608; Case Code (Imperial): 0603; Min Operating Temperature: -55°C; Max Operating Temperature: 155°C; Packaging: Tape and Reel; Composition: Thin Film; Number of Terminations: 2; Tolerance: 0.1%; Features: Anti-Sulfur,Automotive AEC-Q200,Moisture Resistant; Length: 0.063inch; Height: 0.022inch; Width: 0.032inch; Supplier Part Number 1: YAG2113CT-ND
R28-R31 = AC0603JR-0710KL: RES SMD 10K OHM 5% 1/10W 0603; Manufacturer: Yageo; Voltage Rating: 50V; Resistance: 10kR; Power Rating: 100mW; Temperature Coefficient: 100ppm/°C; Supplier 1: Future Electronics; Manufacturer Part Number: AC0603JR-0710KL; RoHS: Yes; Category: Chip SMD Resistors; Stock 1: 1533000; Pricing 1: 5000=0.00540 (USD); Case/Package: 0603; Case Code (Imperial): 0603; Case Code (Metric): 1608; Size Code: 0603; Min Operating Temperature: -55°C; Max Operating Temperature: 155°C; Packaging: Tape and Reel; Tolerance: 5%; Package Quantity: 1; Resistor Type: Thick Film; Termination: SMD/SMT; Number of Terminations: 2; Max Power Dissipation: 100mW; Features: Moisture Resistant,Automotive AEC-Q200,Anti-Sulfur; Series: AC; Construction: Rectangular; Length: 0.063inch; Width: 0.031inch; Height: 0.022inch; Depth: 0.8mm; Military Standard: Not; Lead Free: Lead Free; RoHS Compliant: Yes; ComponentLink1URL: https://datasheet.ciiva.com/5562/pyu-ac-51-rohs-l-2-5562553.pdf?src-supplier=Mouser; ComponentLink1Description: https://datasheet.ciiva.com/5562/pyu-ac-51-rohs-l-2-5562553.pdf?src-supplier=Mouser; Supplier Part Number 1: 1029044